# Altium schematic sheet Rx_PSU.SchDoc
size A4; Date: *******; ApprovedBy: *******; CheckedBy: None; Author: *******; CompanyName: *******; DrawnBy: Name; Engineer: *******; Organization: *******; Address1: *******; Address2: *******; Address3: *******; Address4: *******; DocumentNumber: Doc Num; Revision: *******; SheetNumber: 3; SheetTotal: 8; CurrentTime: *******; CurrentDate: *******; Time: *******; DocumentFullPathAndName: *******; DocumentName: *******; ModifiedDate: *******; ImagePath: *******; ProjectName: *******; Application_BuildNumber: *******
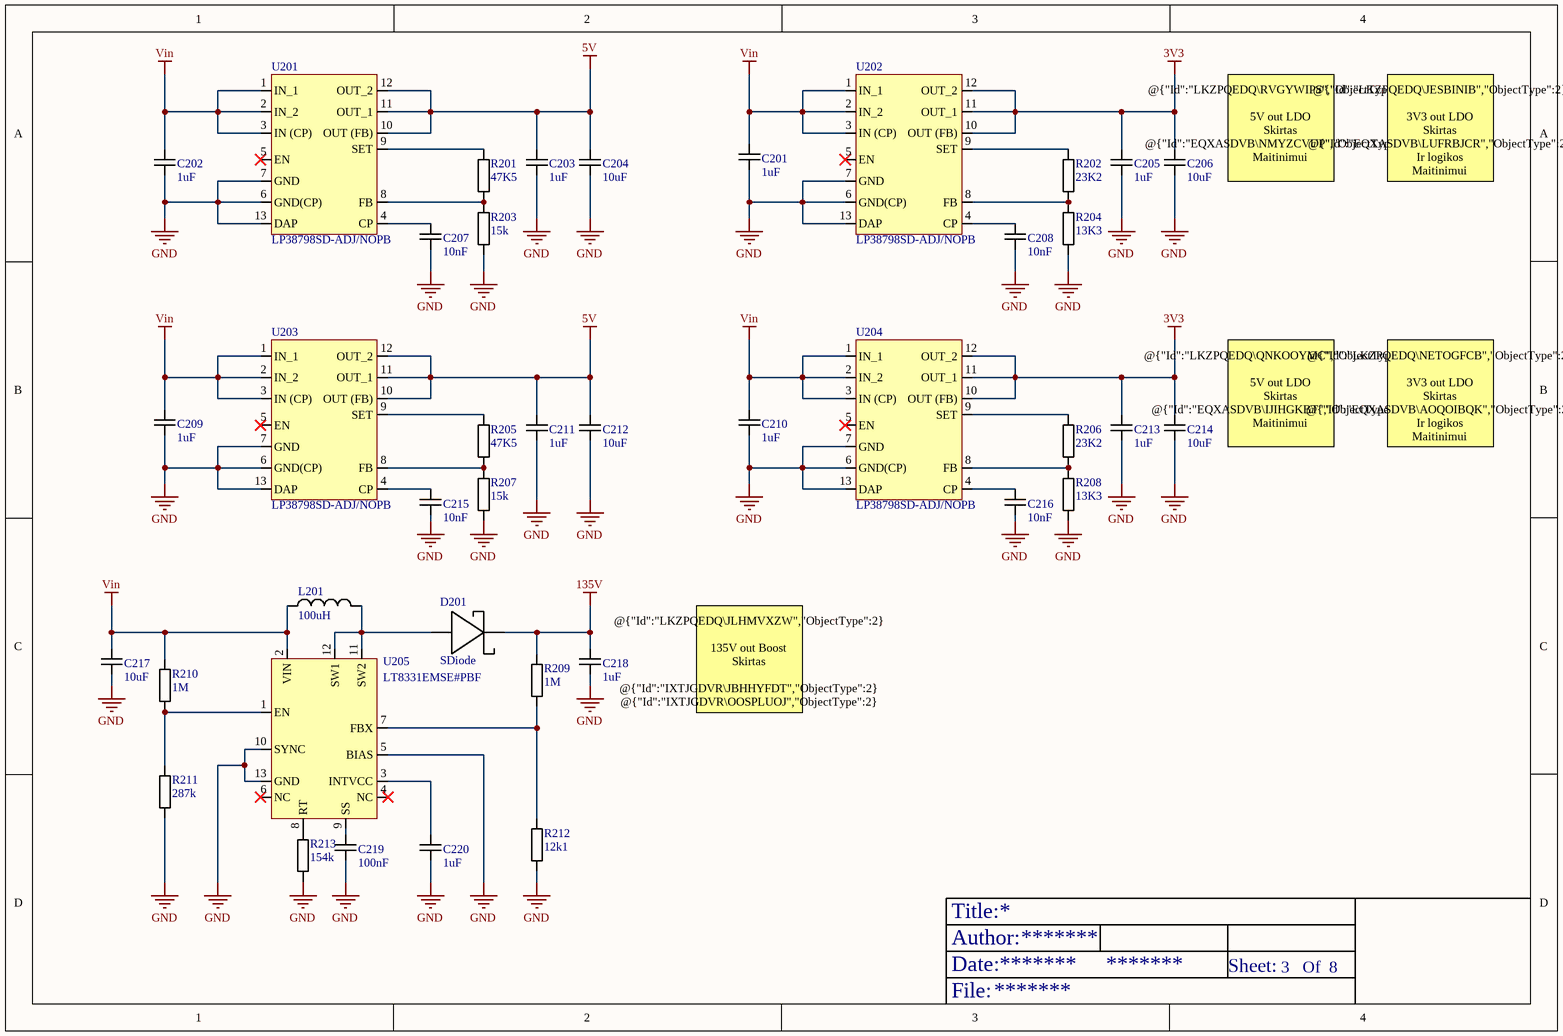
[diagram p0: Rx_PSU.SchDoc]

## Parts
C201  1uF  [1uF 0603]
C202  1uF  [1uF 0603]
C203  1uF  [1uF 0603]
C204  10uF  [10uF 0805]
C205  1uF  [1uF 0603]
C206  10uF  [10uF 0805]
C207  10nF  [10nF 0402]
C208  10nF  [10nF 0402]
C209  1uF  [1uF 0603]
C210  1uF  [1uF 0603]
C211  1uF  [1uF 0603]
C212  10uF  [10uF 0805]
C213  1uF  [1uF 0603]
C214  10uF  [10uF 0805]
C215  10nF  [10nF 0402]
C216  10nF  [10nF 0402]
C217  10uF  [10uF 0805]
C218  1uF  [1uF 2220]
C219  100nF  [100nF 0402]
C220  1uF  [1uF 0603]
D201  SDiode  [SDiode]
L201  100uH  [100uH]
R201  47K5  [47.5k 0402]
R202  23K2  [23.2k 0402]
R203  15k  [15k 0402]
R204  13K3  [13k3 0402]
R205  47K5  [47.5k 0402]
R206  23K2  [23.2k 0402]
R207  15k  [15k 0402]
R208  13K3  [13k3 0402]
R209  1M  [1M 0402]
R210  1M  [1M 0402]
R211  287k  [1M 0402]
R212  12k1  [1M 0402]
R213  154k  [1M 0402]
U201  LP38798SD-ADJ/NOPB  [LP38798SD-ADJ/NOPB]
U202  LP38798SD-ADJ/NOPB  [LP38798SD-ADJ/NOPB]
U203  LP38798SD-ADJ/NOPB  [LP38798SD-ADJ/NOPB]
U204  LP38798SD-ADJ/NOPB  [LP38798SD-ADJ/NOPB]
U205  LT8331EMSE#PBF  [LT8331EMSE#PBF]

## Nets
3V3: C205.2 C206.2 C213.2 C214.2 U202.10(OUT_(FB)) U202.11(OUT_1) U202.12(OUT_2) U204.10(OUT_(FB)) U204.11(OUT_1) U204.12(OUT_2)
5V: C203.2 C204.2 C211.2 C212.2 U201.10(OUT_(FB)) U201.11(OUT_1) U201.12(OUT_2) U203.10(OUT_(FB)) U203.11(OUT_1) U203.12(OUT_2)
135V: C218.2 D201.1 R209.2
GND: C201.1 C202.1 C203.1 C204.1 C205.1 C206.1 C207.1 C208.1 C209.1 C210.1 C211.1 C212.1 C213.1 C214.1 C215.1 C216.1 C217.1 C218.1 C219.1 C220.1 R203.1 R204.1 R207.1 R208.1 R211.1 R212.1 R213.1 U201.6(GND(CP)) U201.7(GND) U201.13(DAP) U202.6(GND(CP)) U202.7(GND) U202.13(DAP) U203.6(GND(CP)) U203.7(GND) U203.13(DAP) U204.6(GND(CP)) U204.7(GND) U204.13(DAP) U205.5(BIAS) U205.10(SYNC) U205.13(GND)
Vin: C201.2 C202.2 C209.2 C210.2 C217.2 L201.1 R210.2 U201.1(IN_1) U201.2(IN_2) U201.3(IN_(CP)) U202.1(IN_1) U202.2(IN_2) U202.3(IN_(CP)) U203.1(IN_1) U203.2(IN_2) U203.3(IN_(CP)) U204.1(IN_1) U204.2(IN_2) U204.3(IN_(CP)) U205.2(VIN)
NetC207_2: C207.2 U201.4(CP)
NetC208_2: C208.2 U202.4(CP)
NetC215_2: C215.2 U203.4(CP)
NetC216_2: C216.2 U204.4(CP)
NetC219_2: C219.2 U205.9(SS)
NetC220_2: C220.2 U205.3(INTVCC)
NetD201_2: D201.2 L201.2 U205.11(SW2) U205.12(SW1)
NetR201_1: R201.1 R203.2 U201.8(FB)
NetR201_2: R201.2 U201.9(SET)
NetR202_1: R202.1 U202.9(SET)
NetR202_2: R202.2 R204.2 U202.8(FB)
NetR205_1: R205.1 R207.2 U203.8(FB)
NetR205_2: R205.2 U203.9(SET)
NetR206_1: R206.1 U204.9(SET)
NetR206_2: R206.2 R208.2 U204.8(FB)
NetR209_1: R209.1 R212.2 U205.7(FBX)
NetR210_1: R210.1 R211.2 U205.1(EN)
NetR213_2: R213.2 U205.8(RT)

Not connected (* = marked no-connect by the designer): U201 5(EN)*; U202 5(EN)*; U203 5(EN)*; U204 5(EN)*; U205 4(NC)* 6(NC)*

## Notes on the sheet
- (near C206) @{"Id":"LKZPQEDQ\RVGYWIPS","ObjectType":2}
  5V out LDO
  Skirtas @{"Id":"EQXASDVB\NMYZCVUP","ObjectType":2}
  Maitinimui
- @{"Id":"LKZPQEDQ\JESBINIB","ObjectType":2}
  3V3 out LDO
  Skirtas @{"Id":"EQXASDVB\LUFRBJCR","ObjectType":2}
  Ir logikos
  Maitinimui
- (near C214) @{"Id":"LKZPQEDQ\QNKOOYMC","ObjectType":2}
  5V out LDO
  Skirtas @{"Id":"EQXASDVB\IJIHGKBT","ObjectType":2}
  Maitinimui
- @{"Id":"LKZPQEDQ\NETOGFCB","ObjectType":2}
  3V3 out LDO
  Skirtas @{"Id":"EQXASDVB\AOQOIBQK","ObjectType":2}
  Ir logikos
  Maitinimui
- @{"Id":"LKZPQEDQ\JLHMVXZW","ObjectType":2}
  135V out Boost
  Skirtas
  @{"Id":"IXTJGDVR\JBHHYFDT","ObjectType":2} @{"Id":"IXTJGDVR\OOSPLUOJ","ObjectType":2}
  Maitinimui
- Title:
- Date:
- Author:
- Sheet:
- Of
- File:

## Library data of the parts
C201-C203 C205 C209-C211 C213 C220 = 1uF 0603: CGA3E1X7R1E105K080AC
C204 C206 C212 C214 C217 = 10uF 0805: GRJ21BR61E106KE01K
C207 C208 C215 C216 = 10nF 0402: C0402C103J5RACTU
C218 = 1uF 2220
C219 = 100n 0402: C1005X7R1E104K050BB
D201 = 755-RB558VAM150TR
L201 = 100uH: 744066101
R201 R205 = 47K5 0402: CR0402-FX-4752GLF
R202 R206 = 23K2 0402: CR0402-FX-2322GLF
R203 R207 = 15k 0402: CRCW040215K0FKED
R204 R208 = 13K3 0402: CRCW040213K3FKED
R209 R210 = 1M 0402: RC0402FR-7D1ML
R211 = 287k 0402: RC0402FR-07287KL
R212 = 12k1 0402: RC0402FR-0712K1L
R213 = 154k 0402: RE0402BRE07154KL
U201-U204 = LP38798SD-ADJ/NOPB: input 3-20V output 1.5-5V